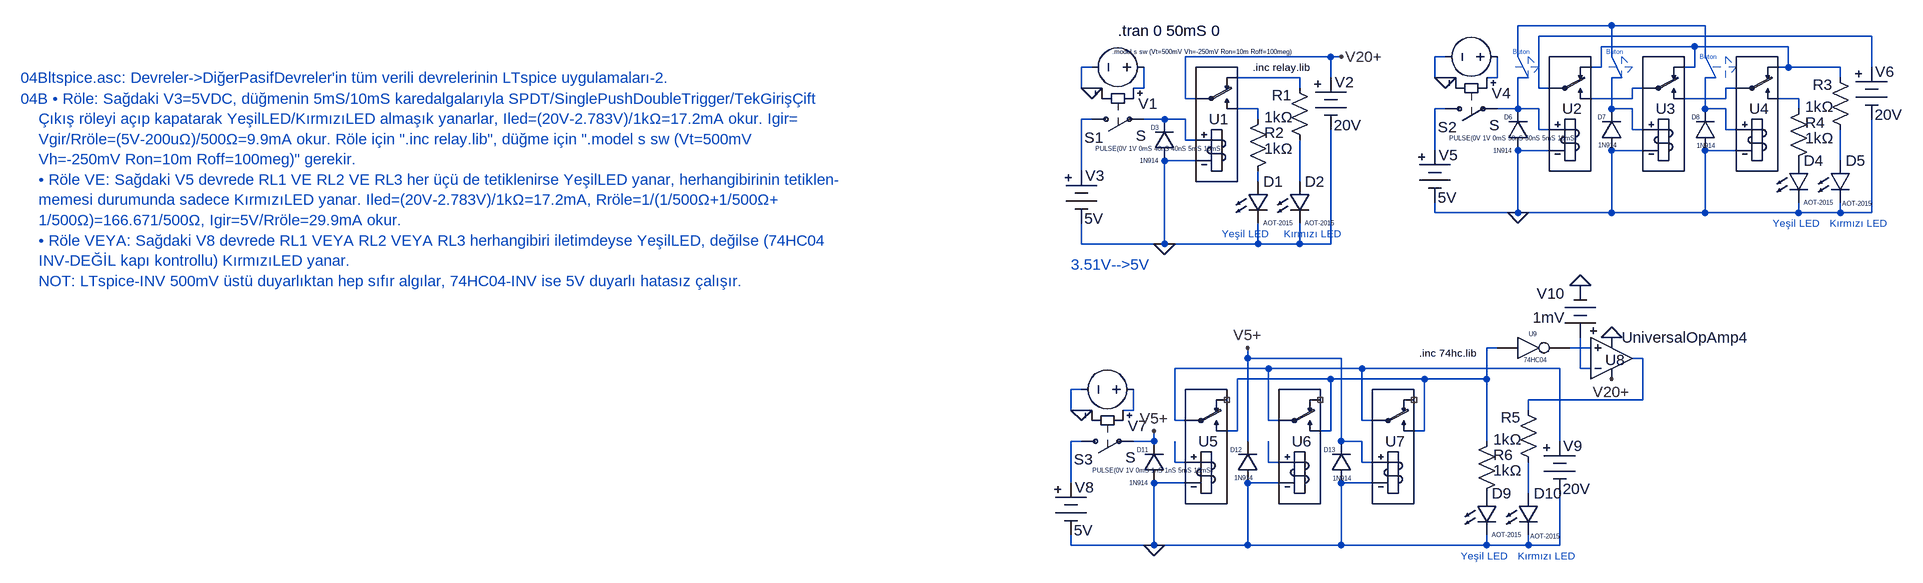
[diagram p0: schematic 04Bltspice.asc]
04Bltspice.asc, the LTspice schematic file:
Version 4
SHEET 1 3200 2492
WIRE 1664 -32 1520 -32
WIRE 1808 -32 1664 -32
WIRE 2064 -16 1552 -16
WIRE 1792 0 1648 0
WIRE 1936 0 1792 0
WIRE 1232 16 1008 16
WIRE 1248 16 1232 16
WIRE 1408 16 1392 16
WIRE 1520 16 1520 -32
WIRE 1664 16 1664 -32
WIRE 1808 16 1808 -32
WIRE 864 32 848 32
WIRE 1648 32 1648 0
WIRE 1648 32 1632 32
WIRE 1792 32 1792 0
WIRE 1792 32 1776 32
WIRE 1936 32 1936 0
WIRE 1936 32 1920 32
WIRE 2016 32 1936 32
WIRE 2064 32 2064 -16
WIRE 1184 48 1088 48
WIRE 1232 48 1232 16
WIRE 1392 48 1392 16
WIRE 1408 48 1392 48
WIRE 1424 48 1408 48
WIRE 1488 48 1488 16
WIRE 1488 48 1472 48
WIRE 1536 48 1520 16
WIRE 1536 48 1520 48
WIRE 1680 48 1664 16
WIRE 1680 48 1664 48
WIRE 1824 48 1808 16
WIRE 1824 48 1808 48
WIRE 2016 48 2016 32
WIRE 848 64 848 32
WIRE 864 64 848 64
WIRE 880 64 864 64
WIRE 944 64 944 32
WIRE 944 64 928 64
WIRE 1184 64 1184 48
WIRE 1552 64 1552 -16
WIRE 1568 64 1552 64
WIRE 1712 64 1696 64
WIRE 1856 64 1840 64
WIRE 1008 80 1008 16
WIRE 1024 80 1008 80
WIRE 1696 80 1696 64
WIRE 1696 80 1632 80
WIRE 1840 80 1840 64
WIRE 1840 80 1776 80
WIRE 1952 80 1920 80
WIRE 1120 96 1088 96
WIRE 1408 96 1392 96
WIRE 1520 96 1520 48
WIRE 1520 96 1488 96
WIRE 1552 96 1520 96
WIRE 1664 96 1664 48
WIRE 1696 96 1664 96
WIRE 1808 96 1808 48
WIRE 1840 96 1808 96
WIRE 1952 96 1952 80
WIRE 864 112 848 112
WIRE 976 112 944 112
WIRE 1008 112 976 112
WIRE 1120 112 1120 96
WIRE 1552 128 1552 96
WIRE 1568 128 1552 128
WIRE 1696 128 1696 96
WIRE 1712 128 1696 128
WIRE 1840 128 1840 96
WIRE 1856 128 1840 128
WIRE 1008 144 1008 112
WIRE 1024 144 1008 144
WIRE 1392 160 1392 96
WIRE 1568 160 1520 160
WIRE 1712 160 1664 160
WIRE 1856 160 1808 160
WIRE 1024 176 976 176
WIRE 2016 176 2016 128
WIRE 848 192 848 112
WIRE 1120 208 1120 192
WIRE 1184 208 1184 144
WIRE 1392 256 1392 240
WIRE 1520 256 1520 160
WIRE 1520 256 1392 256
WIRE 1664 256 1664 160
WIRE 1664 256 1520 256
WIRE 1808 256 1808 160
WIRE 1808 256 1664 256
WIRE 1952 256 1952 240
WIRE 1952 256 1808 256
WIRE 2016 256 2016 240
WIRE 2016 256 1952 256
WIRE 2064 256 2064 112
WIRE 2064 256 2016 256
WIRE 848 304 848 272
WIRE 976 304 976 176
WIRE 976 304 848 304
WIRE 1120 304 1120 272
WIRE 1120 304 976 304
WIRE 1184 304 1184 272
WIRE 1184 304 1120 304
WIRE 1232 304 1232 128
WIRE 1232 304 1184 304
WIRE 1488 464 1472 464
WIRE 1632 464 1600 464
WIRE 1104 480 1104 464
WIRE 1248 480 1104 480
WIRE 1712 480 1696 480
WIRE 1136 496 992 496
WIRE 1280 496 1136 496
WIRE 1584 496 1280 496
WIRE 1616 496 1616 448
WIRE 1632 496 1616 496
WIRE 1232 512 1088 512
WIRE 1376 512 1232 512
WIRE 1472 512 1472 464
WIRE 1472 512 1376 512
WIRE 848 528 832 528
WIRE 1712 544 1712 480
WIRE 1712 544 1536 544
WIRE 832 560 832 528
WIRE 848 560 832 560
WIRE 864 560 848 560
WIRE 928 560 928 528
WIRE 928 560 912 560
WIRE 1536 560 1536 544
WIRE 992 576 992 496
WIRE 1008 576 992 576
WIRE 1136 576 1136 496
WIRE 1152 576 1136 576
WIRE 1280 576 1280 496
WIRE 1296 576 1280 576
WIRE 1088 592 1088 512
WIRE 1088 592 1072 592
WIRE 1232 592 1232 512
WIRE 1232 592 1216 592
WIRE 1376 592 1376 512
WIRE 1376 592 1360 592
WIRE 848 608 832 608
WIRE 960 608 960 592
WIRE 960 608 928 608
WIRE 1104 608 1104 480
WIRE 1248 608 1248 480
WIRE 1280 608 1248 608
WIRE 1472 608 1472 512
WIRE 1584 608 1584 496
WIRE 992 640 992 608
WIRE 1008 640 992 640
WIRE 1136 640 1136 608
WIRE 1152 640 1136 640
WIRE 1280 640 1280 608
WIRE 1296 640 1280 640
WIRE 832 672 832 608
WIRE 1008 672 960 672
WIRE 1152 672 1104 672
WIRE 1296 672 1248 672
WIRE 1536 688 1536 640
WIRE 832 768 832 752
WIRE 960 768 960 672
WIRE 960 768 832 768
WIRE 1104 768 1104 672
WIRE 1104 768 960 768
WIRE 1248 768 1248 672
WIRE 1248 768 1104 768
WIRE 1472 768 1472 752
WIRE 1472 768 1248 768
WIRE 1536 768 1536 752
WIRE 1536 768 1472 768
WIRE 1584 768 1584 688
WIRE 1584 768 1536 768
FLAG 864 64 0
FLAG 976 304 0
FLAG 1408 48 0
FLAG 1520 256 0
FLAG 848 560 0
FLAG 960 768 0
FLAG 960 592 V5+
FLAG 1104 464 V5+
FLAG 1664 512 V20+
FLAG 1616 368 0
FLAG 1664 448 0
FLAG 1248 16 V20+
SYMBOL sw 848 112 M90
WINDOW 0 28 34 VLeft 2
WINDOW 3 25 100 VLeft 2
SYMATTR InstName S1
SYMATTR Value S
SYMBOL voltage 960 32 M270
WINDOW 0 -56 -5 VRight 2
WINDOW 3 -125 -105 VRight 0
WINDOW 123 0 0 Left 0
WINDOW 39 0 0 Left 0
SYMATTR InstName V1
SYMATTR Value PULSE(0V 1V 0mS 40nS 40nS 5mS 10mS)
SYMBOL res 1200 160 R180
WINDOW 0 28 85 Left 2
WINDOW 3 26 51 Left 2
SYMATTR InstName R1
SYMATTR Value 1kΩ
SYMBOL Misc\\battery 848 176 R0
WINDOW 0 6 23 Left 2
WINDOW 3 5 89 Left 2
SYMATTR InstName V3
SYMATTR Value 5V
SYMBOL LED 1104 208 R0
WINDOW 3 24 64 Left 0
SYMATTR Value AOT-2015
SYMATTR InstName D1
SYMATTR Description Diode
SYMATTR Type diode
SYMBOL rly_spdt 1056 96 R0
WINDOW 0 -12 16 Left 2
SYMATTR InstName U1
SYMBOL LED 1168 208 R0
WINDOW 3 24 64 Left 0
SYMATTR Value AOT-2015
SYMATTR InstName D2
SYMATTR Description Diode
SYMATTR Type diode
SYMBOL Misc\\battery 1232 32 R0
WINDOW 0 6 23 Left 2
WINDOW 3 5 89 Left 2
SYMATTR InstName V2
SYMATTR Value 20V
SYMBOL res 1104 208 M180
WINDOW 0 26 75 Left 2
WINDOW 3 26 51 Left 2
SYMATTR InstName R2
SYMATTR Value 1kΩ
SYMBOL diode 992 176 R180
WINDOW 0 24 51 Left 0
WINDOW 3 24 0 Left 0
SYMATTR InstName D3
SYMATTR Value 1N914
SYMBOL sw 1392 96 M90
WINDOW 0 28 34 VLeft 2
WINDOW 3 25 100 VLeft 2
SYMATTR InstName S2
SYMATTR Value S
SYMBOL voltage 1504 16 M270
WINDOW 0 -56 -5 VRight 2
WINDOW 3 -125 -105 VRight 0
WINDOW 123 0 0 Left 0
WINDOW 39 0 0 Left 0
SYMATTR InstName V4
SYMATTR Value PULSE(0V 1V 0mS 50nS 50nS 5mS 10mS)
SYMBOL res 2032 144 R180
WINDOW 0 28 85 Left 2
WINDOW 3 26 51 Left 2
SYMATTR InstName R3
SYMATTR Value 1kΩ
SYMBOL Misc\\battery 1392 144 R0
WINDOW 0 6 23 Left 2
WINDOW 3 5 89 Left 2
SYMATTR InstName V5
SYMATTR Value 5V
SYMBOL LED 1936 176 R0
WINDOW 3 24 64 Left 0
SYMATTR Value AOT-2015
SYMATTR InstName D4
SYMATTR Description Diode
SYMATTR Type diode
SYMBOL rly_spdt 1600 80 R0
WINDOW 0 -12 16 Left 2
SYMATTR InstName U2
SYMBOL LED 2000 176 R0
WINDOW 3 19 66 Left 0
SYMATTR Value AOT-2015
SYMATTR InstName D5
SYMATTR Description Diode
SYMATTR Type diode
SYMBOL Misc\\battery 2064 16 R0
WINDOW 0 6 23 Left 2
WINDOW 3 5 89 Left 2
SYMATTR InstName V6
SYMATTR Value 20V
SYMBOL res 1936 192 M180
WINDOW 0 26 75 Left 2
WINDOW 3 26 51 Left 2
SYMATTR InstName R4
SYMATTR Value 1kΩ
SYMBOL diode 1536 160 R180
WINDOW 0 24 51 Left 0
WINDOW 3 24 0 Left 0
SYMATTR InstName D6
SYMATTR Value 1N914
SYMBOL rly_spdt 1744 80 R0
WINDOW 0 -12 16 Left 2
SYMATTR InstName U3
SYMBOL rly_spdt 1888 80 R0
WINDOW 0 -12 16 Left 2
SYMATTR InstName U4
SYMBOL diode 1680 160 R180
WINDOW 0 24 51 Left 0
WINDOW 3 7 8 Left 0
SYMATTR InstName D7
SYMATTR Value 1N914
SYMBOL diode 1824 160 R180
WINDOW 0 24 51 Left 0
WINDOW 3 -1 7 Left 0
SYMATTR InstName D8
SYMATTR Value 1N914
SYMBOL sw 832 608 M90
WINDOW 0 28 34 VLeft 2
WINDOW 3 25 100 VLeft 2
SYMATTR InstName S3
SYMATTR Value S
SYMBOL voltage 944 528 M270
WINDOW 0 -56 -5 VRight 2
WINDOW 3 -125 -105 VRight 0
WINDOW 123 0 0 Left 0
WINDOW 39 0 0 Left 0
SYMATTR InstName V7
SYMATTR Value PULSE(0V 1V 0mS 1nS 1nS 5mS 10mS)
SYMBOL res 1552 656 R180
WINDOW 0 28 85 Left 2
WINDOW 3 26 51 Left 2
SYMATTR InstName R5
SYMATTR Value 1kΩ
SYMBOL Misc\\battery 832 656 R0
WINDOW 0 6 23 Left 2
WINDOW 3 5 89 Left 2
SYMATTR InstName V8
SYMATTR Value 5V
SYMBOL LED 1456 688 R0
WINDOW 3 24 64 Left 0
SYMATTR Value AOT-2015
SYMATTR InstName D9
SYMATTR Description Diode
SYMATTR Type diode
SYMBOL rly_spdt 1040 592 R0
WINDOW 0 -12 16 Left 2
SYMATTR InstName U5
SYMBOL LED 1520 688 R0
WINDOW 3 19 66 Left 0
SYMATTR Value AOT-2015
SYMATTR InstName D10
SYMATTR Description Diode
SYMATTR Type diode
SYMBOL Misc\\battery 1584 592 R0
WINDOW 0 6 23 Left 2
WINDOW 3 5 89 Left 2
SYMATTR InstName V9
SYMATTR Value 20V
SYMBOL res 1456 704 M180
WINDOW 0 26 75 Left 2
WINDOW 3 26 51 Left 2
SYMATTR InstName R6
SYMATTR Value 1kΩ
SYMBOL diode 976 672 R180
WINDOW 0 24 51 Left 0
WINDOW 3 24 0 Left 0
SYMATTR InstName D11
SYMATTR Value 1N914
SYMBOL rly_spdt 1184 592 R0
WINDOW 0 -12 16 Left 2
SYMATTR InstName U6
SYMBOL rly_spdt 1328 592 R0
WINDOW 0 -12 16 Left 2
SYMATTR InstName U7
SYMBOL diode 1120 672 R180
WINDOW 0 24 51 Left 0
WINDOW 3 7 8 Left 0
SYMATTR InstName D12
SYMATTR Value 1N914
SYMBOL diode 1264 672 R180
WINDOW 0 24 51 Left 0
WINDOW 3 -1 7 Left 0
SYMATTR InstName D13
SYMATTR Value 1N914
SYMBOL OpAmps\\UniversalOpAmp4 1664 480 M180
WINDOW 0 -10 -3 Left 2
SYMATTR InstName U8
SYMBOL Misc\\battery 1616 464 R180
WINDOW 0 24 84 Left 2
WINDOW 3 24 47 Left 2
SYMATTR InstName V10
SYMATTR Value 1mV
SYMBOL 74hc04 1536 400 R0
WINDOW 0 1 43 Left 0
WINDOW 3 -7 83 Left 0
SYMATTR InstName U9
TEXT -784 48 Left 2 ;04Bltspice.asc: Devreler->DiğerPasifDevreler'in tüm verili devrelerinin LTspice uygulamaları-2.
TEXT -784 80 Left 2 ;04B • Röle: Sağdaki V3=5VDC, düğmenin 5mS/10mS karedalgalarıyla SPDT/SinglePushDoubleTrigger/TekGirişÇift\n    Çıkış röleyi açıp kapatarak YeşilLED/KırmızıLED almaşık yanarlar, Iled=(20V-2.783V)/1kΩ=17.2mA okur. Igir=\n    Vgir/Rröle=(5V-200uΩ)/500Ω=9.9mA okur. Röle için ".inc relay.lib", düğme için ".model s sw (Vt=500mV \n    Vh=-250mV Ron=10m Roff=100meg)" gerekir.\n    • Röle VE: Sağdaki V5 devrede RL1 VE RL2 VE RL3 her üçü de tetiklenirse YeşilLED yanar, herhangibirinin tetiklen-\n    memesi durumunda sadece KırmızıLED yanar. Iled=(20V-2.783V)/1kΩ=17.2mA, Rröle=1/(1/500Ω+1/500Ω+\n    1/500Ω)=166.671/500Ω, Igir=5V/Rröle=29.9mA okur.\n    • Röle VEYA: Sağdaki V8 devrede RL1 VEYA RL2 VEYA RL3 herhangibiri iletimdeyse YeşilLED, değilse (74HC04\n    INV-DEĞİL kapı kontrollu) KırmızıLED yanar.\n    NOT: LTspice-INV 500mV üstü duyarlıktan hep sıfır algılar, 74HC04-INV ise 5V duyarlı hatasız çalışır.
TEXT 1112 32 Left 1 !.inc relay.lib
TEXT 896 8 Left 0 !.model s sw (Vt=500mV Vh=-250mV Ron=10m Roff=100meg)
TEXT 1160 288 Left 1 ;Kırmızı LED
TEXT 1064 288 Left 1 ;Yeşil LED
TEXT 904 -24 Left 2 !.tran 0 50mS 0
TEXT 832 336 Left 2 ;3.51V-->5V
TEXT 2000 272 Left 1 ;Kırmızı LED
TEXT 1912 272 Left 1 ;Yeşil LED
TEXT 1800 16 Left 0 ;Buton
TEXT 1512 8 Left 0 ;Buton
TEXT 1656 8 Left 0 ;Buton
TEXT 1520 784 Left 1 ;Kırmızı LED
TEXT 1432 784 Left 1 ;Yeşil LED
TEXT 1368 472 Left 1 !.inc 74hc.lib
LINE Normal 1856 32 1808 32 2
LINE Normal 1840 16 1856 32 2
LINE Normal 1840 48 1840 16 2
LINE Normal 1856 32 1840 48 2
LINE Normal 1552 32 1504 32 2
LINE Normal 1536 16 1552 32 2
LINE Normal 1536 48 1536 16 2
LINE Normal 1552 32 1536 48 2
LINE Normal 1696 32 1648 32 2
LINE Normal 1680 16 1696 32 2
LINE Normal 1680 48 1680 16 2
LINE Normal 1696 32 1680 48 2

The netlist it stands for:
* 04Bltspice.asc
S1 N012 N013 N006 0 S
V1 N006 0 PULSE(0V 1V 0mS 40nS 40nS 5mS 10mS)
R1 N016 N004 1kΩ
V3 N012 0 5V
D1 N015 0 AOT-2015
XU1 N013 0 V20+ N010 N004 RLY_SPDT0  ; pins L+ L- SIN SON SOFF
D2 N016 0 AOT-2015
V2 V20+ 0 20V
R2 N015 N010 1kΩ
D3 0 N013 1N914
S2 N011 N001 N005 0 S
V4 N005 0 PULSE(0V 1V 0mS 50nS 50nS 5mS 10mS)
R3 N014 N003 1kΩ
V5 N011 0 5V
D4 P001 0 AOT-2015
XU2 N001 0 N002 N007 N003 RLY_SPDT0  ; pins L+ L- SIN SON SOFF
D5 N014 0 AOT-2015
V6 N002 0 20V
R4 P001 N009 1kΩ
D6 0 N001 1N914
XU3 N001 0 N007 N008 N003 RLY_SPDT0  ; pins L+ L- SIN SON SOFF
XU4 N001 0 N008 N009 N003 RLY_SPDT0  ; pins L+ L- SIN SON SOFF
D7 0 N001 1N914
D8 0 N001 1N914
S3 N023 V5+ N022 0 S
V7 N022 0 PULSE(0V 1V 0mS 1nS 1nS 5mS 10mS)
R5 N026 N019 1kΩ
V8 N023 0 5V
D9 P002 0 AOT-2015
XU5 N024 0 N020 N017 NC_01 RLY_SPDT0  ; pins L+ L- SIN SON SOFF
D10 N026 0 AOT-2015
V9 N020 0 20V
R6 P002 N017 1kΩ
D11 0 V5+ 1N914
XU6 N025 0 N020 N017 NC_02 RLY_SPDT0  ; pins L+ L- SIN SON SOFF
XU7 V5+ 0 N020 N017 NC_03 RLY_SPDT0  ; pins L+ L- SIN SON SOFF
D12 0 V5+ 1N914
D13 0 V5+ 1N914
* U8: UniversalOpAmp4 (symbol OpAmps\UniversalOpAmp4 not available, pins judged from their places): In+=N018 In-=N021 V+=V20+ V-=0 OUT=N019
V10 N021 0 1mV
XU9 N017 N018 VCC 0 74HC04 VCC=5  SPEED=1.0  TRIPDT=1e-9  ; pins A Y
.model D D
.lib standard.dio
* 04Bltspice.asc: Devreler->DiğerPasifDevreler'in tüm verili devrelerinin LTspice uygulamaları-2.
* 04B • Röle: Sağdaki V3=5VDC, düğmenin 5mS/10mS karedalgalarıyla SPDT/SinglePushDoubleTrigger/TekGirişÇift
*     Çıkış röleyi açıp kapatarak YeşilLED/KırmızıLED almaşık yanarlar, Iled=(20V-2.783V)/1kΩ=17.2mA okur. Igir=
*     Vgir/Rröle=(5V-200uΩ)/500Ω=9.9mA okur. Röle için ".inc relay.lib", düğme için ".model s sw (Vt=500mV
*     Vh=-250mV Ron=10m Roff=100meg)" gerekir.
*     • Röle VE: Sağdaki V5 devrede RL1 VE RL2 VE RL3 her üçü de tetiklenirse YeşilLED yanar, herhangibirinin tetiklen-
*     memesi durumunda sadece KırmızıLED yanar. Iled=(20V-2.783V)/1kΩ=17.2mA, Rröle=1/(1/500Ω+1/500Ω+
*     1/500Ω)=166.671/500Ω, Igir=5V/Rröle=29.9mA okur.
*     • Röle VEYA: Sağdaki V8 devrede RL1 VEYA RL2 VEYA RL3 herhangibiri iletimdeyse YeşilLED, değilse (74HC04
*     INV-DEĞİL kapı kontrollu) KırmızıLED yanar.
*     NOT: LTspice-INV 500mV üstü duyarlıktan hep sıfır algılar, 74HC04-INV ise 5V duyarlı hatasız çalışır.
.inc relay.lib
.model s sw (Vt=500mV Vh=-250mV Ron=10m Roff=100meg)
* Kırmızı LED
* Yeşil LED
.tran 0 50mS 0
* 3.51V-->5V
* Kırmızı LED
* Yeşil LED
* Buton
* Buton
* Buton
* Kırmızı LED
* Yeşil LED
.inc 74hc.lib
.lib relay.lib
.backanno
.end